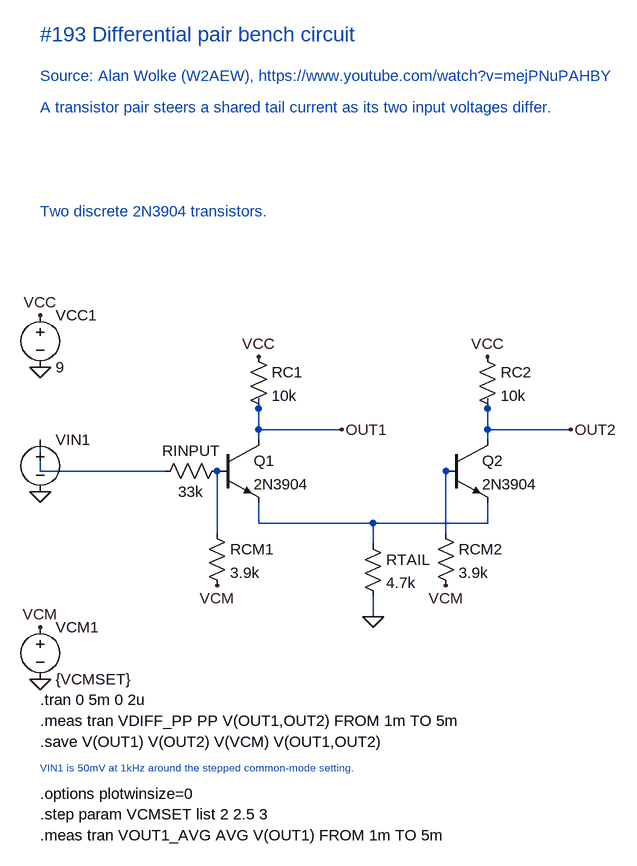
[diagram p0: schematic Differential pair bench circuit.asc]
Differential pair bench circuit.asc, the LTspice schematic file:
Version 4.1
SHEET 1 1320 880
WIRE 464 160 464 144
WIRE 464 192 464 160
WIRE 464 208 464 192
WIRE 592 192 464 192
WIRE 816 160 816 144
WIRE 816 192 816 160
WIRE 816 208 816 192
WIRE 944 192 816 192
WIRE 464 336 464 304
WIRE 640 336 464 336
WIRE 816 336 640 336
WIRE 816 336 816 304
WIRE 640 368 640 336
WIRE 640 480 640 448
WIRE 400 256 400 256
WIRE 320 256 128 256
WIRE 128 256 128 208
WIRE 752 256 752 256
WIRE 400 352 400 256
WIRE 752 352 752 256
FLAG 464 80 VCC
FLAG 816 80 VCC
FLAG 592 192 OUT1
FLAG 944 192 OUT2
FLAG 640 480 0
FLAG 400 432 VCM
FLAG 752 432 VCM
FLAG 128 288 0
FLAG 128 16 VCC
FLAG 128 96 0
FLAG 128 496 VCM
FLAG 128 576 0
SYMBOL voltage 128 0 R0
SYMATTR InstName VCC1
SYMATTR Value 9
SYMBOL voltage 128 192 R0
WINDOW 3 0 0 Invisible 2
SYMATTR InstName VIN1
SYMATTR Value SINE({VCMSET} 50m 1k)
SYMBOL voltage 128 480 R0
SYMATTR InstName VCM1
SYMATTR Value {VCMSET}
SYMBOL res 448 64 R0
SYMATTR InstName RC1
SYMATTR Value 10k
SYMBOL res 800 64 R0
SYMATTR InstName RC2
SYMATTR Value 10k
SYMBOL npn 400 208 R0
SYMATTR InstName Q1
SYMATTR Value 2N3904
SYMBOL npn 752 208 R0
SYMATTR InstName Q2
SYMATTR Value 2N3904
SYMBOL res 416 240 R90
WINDOW 0 0 56 VBottom 2
WINDOW 3 32 56 VTop 2
SYMATTR InstName RINPUT
SYMATTR Value 33k
SYMBOL res 384 336 R0
SYMATTR InstName RCM1
SYMATTR Value 3.9k
SYMBOL res 736 336 R0
SYMATTR InstName RCM2
SYMATTR Value 3.9k
SYMBOL res 624 352 R0
SYMATTR InstName RTAIL
SYMATTR Value 4.7k
TEXT 128 752 Left 2 !.options plotwinsize=0
TEXT 128 608 Left 2 !.tran 0 5m 0 2u
TEXT 128 640 Left 2 !.meas tran VDIFF_PP PP V(OUT1,OUT2) FROM 1m TO 5m
TEXT 128 784 Left 2 !.step param VCMSET list 2 2.5 3
TEXT 128 816 Left 2 !.meas tran VOUT1_AVG AVG V(OUT1) FROM 1m TO 5m
TEXT 128 672 Left 2 !.save V(OUT1) V(OUT2) V(VCM) V(OUT1,OUT2)
TEXT 128 712 Left 1 ;VIN1 is 50mV at 1kHz around the stepped common-mode setting.
TEXT 128 -144 Left 2 ;Two discrete 2N3904 transistors.
TEXT 128 -416 Left 3 ;#193 Differential pair bench circuit
TEXT 128 -352 Left 2 ;Source: Alan Wolke (W2AEW), https://www.youtube.com/watch?v=mejPNuPAHBY
TEXT 128 -304 Left 2 ;A transistor pair steers a shared tail current as its two input voltages differ.

The netlist it stands for:
* Differential pair bench circuit.asc
VCC1 VCC 0 9
VIN1 N003 0 SINE({VCMSET} 50m 1k)
VCM1 VCM 0 {VCMSET}
RC1 VCC OUT1 10k
RC2 VCC OUT2 10k
Q1 OUT1 N002 N001 0 2N3904
Q2 OUT2 N004 N001 0 2N3904
RINPUT N002 N003 33k
RCM1 N002 VCM 3.9k
RCM2 N004 VCM 3.9k
RTAIL N001 0 4.7k
.model NPN NPN
.model PNP PNP
.lib standard.bjt
.options plotwinsize=0
.tran 0 5m 0 2u
.meas tran VDIFF_PP PP V(OUT1,OUT2) FROM 1m TO 5m
.step param VCMSET list 2 2.5 3
.meas tran VOUT1_AVG AVG V(OUT1) FROM 1m TO 5m
.save V(OUT1) V(OUT2) V(VCM) V(OUT1,OUT2)
* VIN1 is 50mV at 1kHz around the stepped common-mode setting.
* Two discrete 2N3904 transistors.
* #193 Differential pair bench circuit
* Source: Alan Wolke (W2AEW), https://www.youtube.com/watch?v=mejPNuPAHBY
* A transistor pair steers a shared tail current as its two input voltages differ.
.backanno
.end